# Altium schematic sheet Controller_Sheet.SchDoc
size A4; DocumentNumber: 5; SheetNumber: 5; SheetTotal: 11
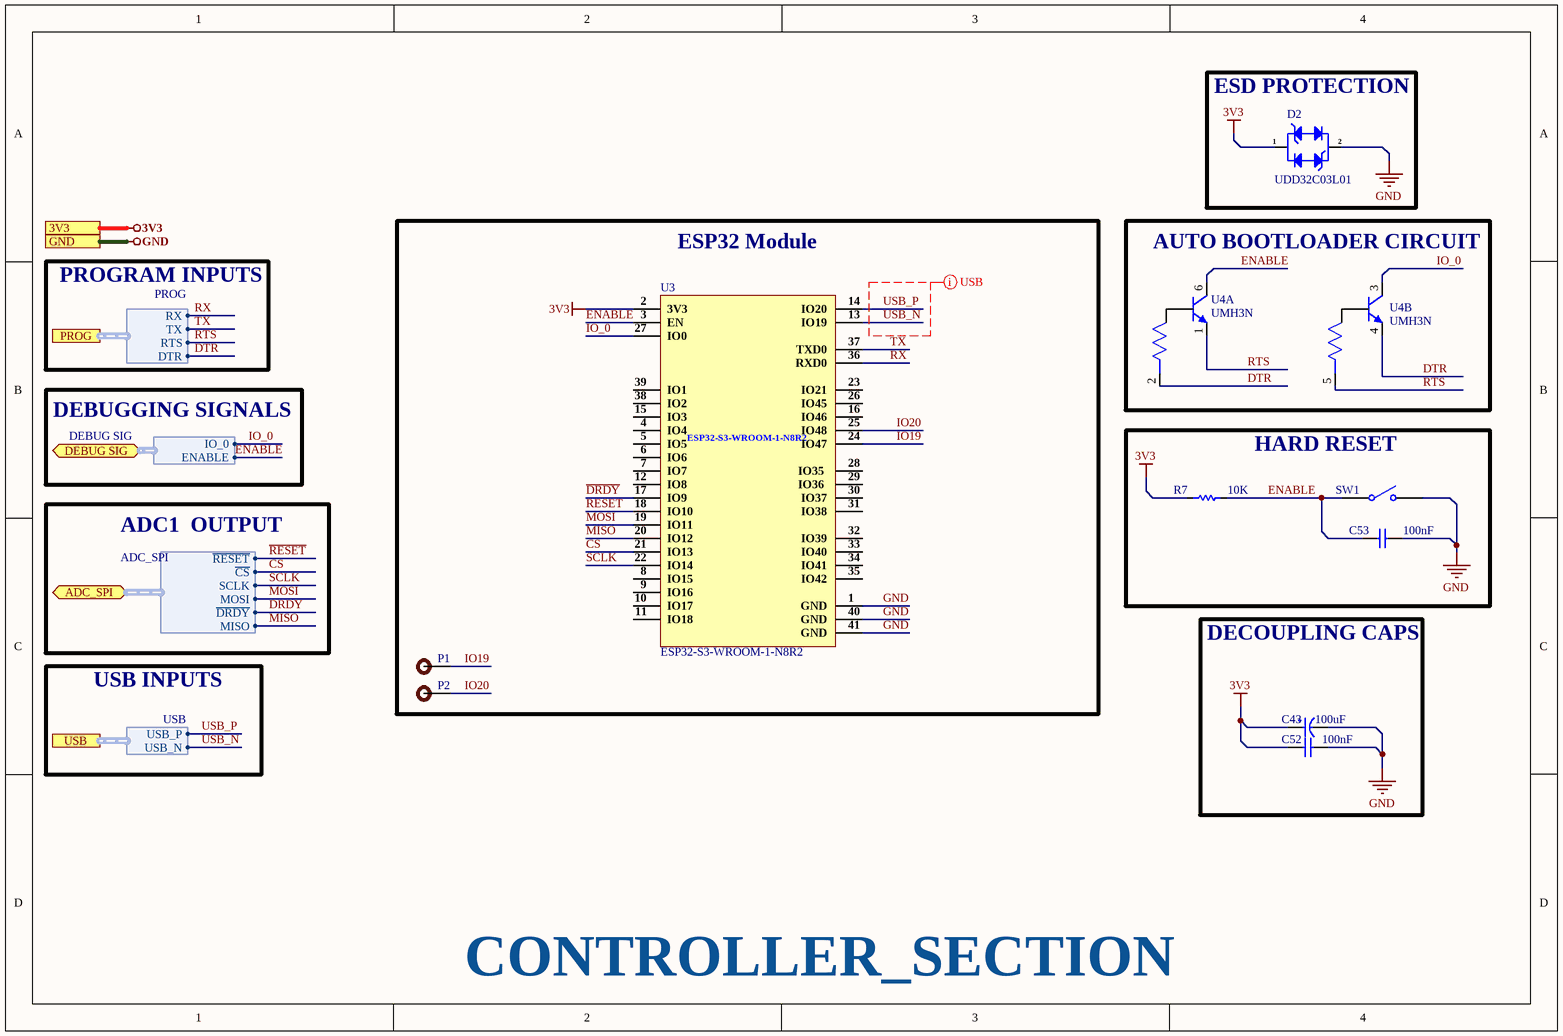
[diagram p0: Controller_Sheet.SchDoc]

## Parts
C43  100uF  [Case-B]
C52  100nF  [Cap-0603]
C53  100nF  [Cap-0603]
D2  UDD32C03L01  [SOD-323]
P1  TEST POINT  [Test-point]  (value not drawn)
P2  TEST POINT  [Test-point]  (value not drawn)
R7  10K  [Res-0603]
SW1  (no value)  [TS-1185EC-C-D-B]
U3  ESP32-S3-WROOM-1-N8R2  [41-SMD Module]
U4  UMH3N  [UMH3N]  (parts A,B of 2)

## Blocks framed on the sheet
ESD PROTECTION: D2
ESP32 Module: P1 P2 U3
AUTO BOOTLOADER CIRCUIT: U4
HARD RESET: C53 R7 SW1
DECOUPLING CAPS: C43 C52

## Ports
3V3, ADC_SPI (bidir, harness ADC_SPI), DEBUG SIG (bidir, harness DEBUG SIG), GND, PROG (harness PROG), USB (harness USB)

## Harnesses
PROG: RX, TX, RTS, DTR
ADC_SPI: ~{RESET}, ~{CS}, SCLK, MOSI, ~{DRDY}, MISO
DEBUG SIG: IO_0, ENABLE
USB: USB_P, USB_N

## Nets
3V3: C43.1 C52.1 D2.1 R7.1 U3.2(3V3) ; port 3V3
GND: C43.2 C52.2 C53.2 D2.2 SW1.2 U3.1(GND) U3.40(GND) U3.41(GND) ; port GND
~{CS}: U3.21(IO13) ; port ADC_SPI.~{CS}
~{DRDY}: U3.17(IO9) ; port ADC_SPI.~{DRDY}
~{RESET}: U3.18(IO10) ; port ADC_SPI.~{RESET}
DTR: U4.2 U4.4(E) ; port PROG.DTR
ENABLE: C53.1 R7.2 SW1.1 U3.3(EN) U4.6(C) ; port DEBUG SIG.ENABLE
IO19: P1.1 U3.24(IO47)
IO20: P2.1 U3.25(IO48)
IO_0: U3.27(IO0) U4.3(C) ; port DEBUG SIG.IO_0
MISO: U3.20(IO12) ; port ADC_SPI.MISO
MOSI: U3.19(IO11) ; port ADC_SPI.MOSI
RTS: U4.1(E) U4.5 ; port PROG.RTS
RX: U3.36(RXD0) ; port PROG.RX
SCLK: U3.22(IO14) ; port ADC_SPI.SCLK
TX: U3.37(TXD0) ; port PROG.TX
USB_N: U3.13(IO19) ; port USB.USB_N
USB_P: U3.14(IO20) ; port USB.USB_P

Not connected (* = marked no-connect by the designer): U3 4(IO4) 5(IO5) 6(IO6) 7(IO7) 8(IO15) 9(IO16) 10(IO17) 11(IO18) 12(IO8) 15(IO3) 16(IO46) 23(IO21) 26(IO45) 28(IO35_) 29(IO36_) 30(IO37) 31(IO38) 32(IO39) 33(IO40) 34(IO41) 35(IO42) 38(IO2) 39(IO1)

## Layout directives
differential pair; net class USB; differential pair class USB_Lines; rule Matched Net Lengths [Tolerance = 20mil]; rule Impedance Constraint [Min = 85.00    Max = 95.00    ]: USB_N, USB_P

## Notes on the sheet
- PROGRAM INPUTS
- DEBUGGING SIGNALS
- ADC1  OUTPUT
- USB INPUTS
- CONTROLLER_SECTION
- File:
- Title:
- Date:
- Page
- Num:
- Total:
- Drawn By: Huzaifa Ali

## Library data of the parts
C43 = TAJB107M010RNJ: CAP TANT 100UF 20% 10V 1411; Manufacturer: Kyocera AVX; Dielectric Material: Tantalum; Tolerance: 10%; ESR (Equivalent Series Resistance): 1.4R; Leakage Current: 10uA; Dissipation Factor: 8%; Item Type: Capacitor; Supplier 1: Rs; Manufacturer Part Number: TAJB107M010RNJ; RoHS: Yes; Category: Tantalum Capacitors; Stock 1: 17520; Pricing 1: 2000=0.302 (GBP); Mounting Technology: Surface Mount; Case/Package: 1210; Case Code (Imperial): 1210; Case Code (Metric): 3528; Min Operating Temperature: -55°C; Max Operating Temperature: 125°C; Value: 100uF; Voltage Rating (DC): 10V; Series: TAJ; Construction: Flat; Voltage Rating: 10V; Package Quantity: 2000; Packaging: Tape and Reel; Termination: SMD/SMT; Voltage: 10V; Features: General Purpose; Length: 3.5mm; Width: 2.8mm; Height: 2.1mm; Depth: 2.8mm; Radiation Hardening: No; Lead Free: Lead Free; RoHS Compliant: Yes; Reach SVHC Compliant: No; ComponentLink1URL: https://datasheet.ciiva.com/264/taj-264281.pdf?src-supplier=Digi-Key; ComponentLink1Description: https://datasheet.ciiva.com/264/taj-264281.pdf?src-supplier=Digi-Key; ComponentLink2URL: https://datasheet.ciiva.com/264/taj-264280.pdf?src-supplier=Digi-Key; ComponentLink2Description: https://datasheet.ciiva.com/264/taj-264280.pdf?src-supplier=Digi-Key; ComponentLink3URL: https://datasheet.ciiva.com/264/taj-264282.pdf?src-supplier=Digi-Key; ComponentLink3Description: https://datasheet.ciiva.com/264/taj-264282.pdf?src-supplier=Digi-Key; ComponentLink4URL: https://datasheet.ciiva.com/11225/taj-11225964.pdf?src-supplier=Avnet; ComponentLink4Description: https://datasheet.ciiva.com/11225/taj-11225964.pdf?src-supplier=Avnet; ComponentLink5URL: https://datasheet.ciiva.com/11225/taj-11225963.pdf?src-supplier=Avnet; ComponentLink5Description: https://datasheet.ciiva.com/11225/taj-11225963.pdf?src-supplier=Avnet; Supplier Part Number 1: 1354069; LCSC Part Number: C7196
C52 C53 = CC0603KRX5R9BB104: CAP CER 0.1UF 50V X5R 0603; Manufacturer: Yageo; Tolerance: 10%; Item Type: Capacitor; Supplier 1: Digi-Key; Manufacturer Part Number: CC0603KRX5R9BB104; RoHS: Yes; Category: Ceramic Capacitors; Stock 1: 152253; Pricing 1: 1=0.10000, 10=0.05200, 50=0.02820, 100=0.02310, 500=0.01648, 1000=0.01294 (USD); Mount: Surface Mount; Case/Package: 0603; Case Code (Imperial): 0603; Case Code (Metric): 1608; Weight: 7.1E-05oz; Min Operating Temperature: -55°C; Max Operating Temperature: 85°C; Capacitance: 100nF; Packaging: Tape and Reel; Voltage Rating: 50V; Dielectric: X5R; Termination: SMD/SMT; Voltage Rating (DC): 50V; Package Quantity: 4000; Length: 0.063inch; Width: 0.031inch; Thickness: 0.035inch; Lead Free: Lead Free; Halogen Free: Halogen Free; ComponentLink1URL: http://www.mouser.com/ds/2/447/Yageo_UPY-GP_NP0_16V-to-50V_9-358835.pdf?src-supplier=Mouser; ComponentLink1Description: http://www.mouser.com/ds/2/447/Yageo_UPY-GP_NP0_16V-to-50V_9-358835.pdf?src-supplier=Mouser; ComponentLink2URL: https://www.yageo.com/upload/media/product/productsearch/datasheet/mlcc/UPY-GPHC_X5R_4V-to-50V_26.pdf?src-supplier=Digi-Key; ComponentLink2Description: https://www.yageo.com/upload/media/product/productsearch/datasheet/mlcc/UPY-GPHC_X5R_4V-to-50V_26.pdf?src-supplier=Digi-Key; ComponentLink3URL: http://www.yageo.com/exep/pages/download/literatures/ProductSelectionGuide%202014_Final_2.pdf?src-supplier=Digi-Key; ComponentLink3Description: http://www.yageo.com/exep/pages/download/literatures/ProductSelectionGuide%202014_Final_2.pdf?src-supplier=Digi-Key; Supplier Part Number 1: 311-4046-1-ND; LCSC Part Number: C110022
D2 = UDD32C03L01: 15V 19A 3.3V 4V Bidirectional SOD-323 ESD Protection Devices ROHS; Manufacturer: Brightking; Item Type: ESD Diode; Manufacturer Part Number: UDD32C03L01; ComponentLink1Description: LCSC; ComponentLink1URL: https://lcsc.com/product-detail/span-style-background-color-ff0-ESD-span-Protection-Devices_Brightking-Elec-TAIWAN-UDD32C03L01_C78439.html; LCSC Part Number: C78439
P1 P2 = TEST POINT: Test Point ON
R7 = AC0603JR-0710KL: RES SMD 10K OHM 5% 1/10W 0603; Manufacturer: Yageo; Voltage Rating: 50V; Resistance: 10kR; Power Rating: 100mW; Temperature Coefficient: 100ppm/°C; Item Type: Resistor; Supplier 1: Future Electronics; Manufacturer Part Number: AC0603JR-0710KL; RoHS: Yes; Category: Chip SMD Resistors; Stock 1: 1533000; Pricing 1: 5000=0.00540 (USD); Case/Package: 0603; Case Code (Imperial): 0603; Case Code (Metric): 1608; Size Code: 0603; Min Operating Temperature: -55°C; Max Operating Temperature: 155°C; Packaging: Tape and Reel; Tolerance: 5%; Package Quantity: 1; Resistor Type: Thick Film; Termination: SMD/SMT; Number of Terminations: 2; Max Power Dissipation: 100mW; Features: Moisture Resistant,Automotive AEC-Q200,Anti-Sulfur; Series: AC; Construction: Rectangular; Length: 0.063inch; Width: 0.031inch; Height: 0.022inch; Depth: 0.8mm; Military Standard: Not; Lead Free: Lead Free; RoHS Compliant: Yes; ComponentLink1URL: https://datasheet.ciiva.com/5562/pyu-ac-51-rohs-l-2-5562553.pdf?src-supplier=Mouser; ComponentLink1Description: https://datasheet.ciiva.com/5562/pyu-ac-51-rohs-l-2-5562553.pdf?src-supplier=Mouser; Supplier Part Number 1: 1029044; LCSC Part Number: C140867
SW1 = TS-1185EC-C-D-B: 3mm 2mm Round Button 50mA Top3.65mm SPST 12V SMD Tactile Switches; Manufacturer: XKB; Manufacturer Part No: TS-1185EC-C-D-B; Package: Custom; ComponentLink1Description: LCSC; ComponentLink1URL: https://lcsc.com/product-detail/Tactile-Switches_XKB-Connectivity-TS-1185EC-C-D-B_C318893.html
U3 = ESP32-S3-WROOM-1-N8R2: SMD,18x25.5mm WiFi Modules ROHS; Manufacturer: Espressif Systems; Item Type: Module; Supplier 1: Digi-Key; Manufacturer Part Number: ESP32-S3-WROOM-1-N8R2; RoHS: No; Category: Uncategorized; Supplier Part Number 1: 1965-ESP32-S3-WROOM-1-N8R2-ND; LCSC Part Number: C2913204; ComponentLink1Description: LCSC; ComponentLink1URL: https://www.lcsc.com/product-detail/WiFi-Modules_Espressif-Systems-ESP32-S3-WROOM-1-N8R2_C2913204.html
U4 = UMH3N: 2 NPN pre-biased (Dual) 150mW 100mA 50V SC-70-6(SOT-363) Digital Transistors ROHS; Manufacturer: Changjiang; Manufacturer Part No: UMH3N; Package: SC-70-6(SOT-363); ComponentLink1Description: LCSC; ComponentLink1URL: https://www.lcsc.com/product-detail/Digital-Transistors_Changjiang-Electronics-Tech-CJ-UMH3N_C62892.html